# Altium project PCB_Batterie_ESP.PrjPcb
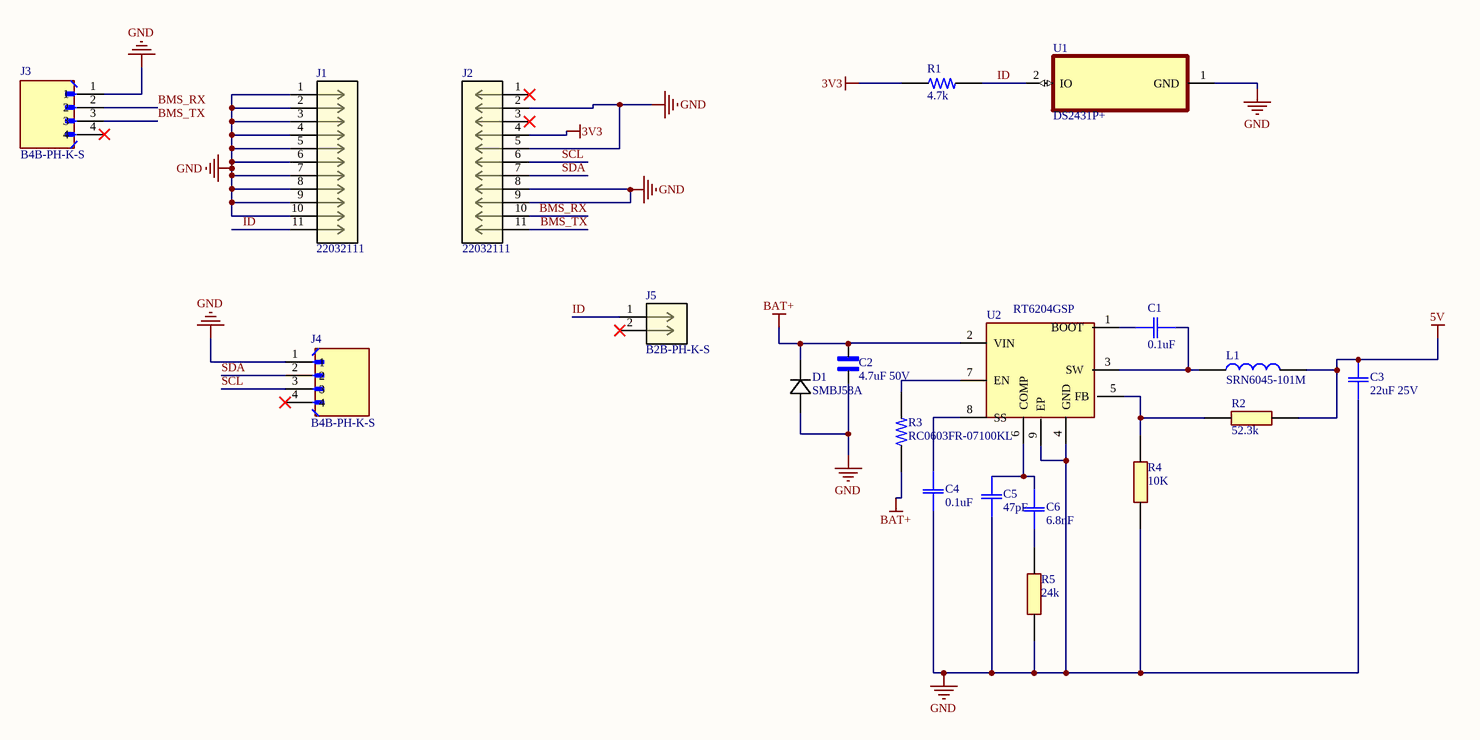
[diagram p0: PCB_Batterie_ESP.SchDoc]
1 sheet, 20 parts. Net scope: global (net labels, ports and power ports of the same name join across sheets).
Board file: PCB_Batterie_ESP.PcbDoc

## Sheet PCB_Batterie_ESP.SchDoc
size A2; SheetNumber: 1; SheetTotal: 1

### Parts
C1  0.1uF  [CAP_CL10_SAM]
C2  4.7uF 50V  [CAPC3216X180N]
C3  22uF 25V  [CAP_CC0805_YAG]
C4  0.1uF  [CAP_CL10_SAM]
C5  47pF  [CAP_CL10_SAM]
C6  6.8nF  [CAP_CL10_SAM]
D1  SMBJ58A  [SMB_STM]
J1  22032111  [CONN_SD-4030-0001_11_MOL]
J2  22032111  [CONN_SD-4030-0001_11_MOL]
J3  B4B-PH-K-S  [JST_B4B-PH-K-S]
J4  B4B-PH-K-S  [JST_B4B-PH-K-S]
J5  B2B-PH-K-S  [CONN2_B2B-PH-K-S_JST]
L1  SRN6045-101M  [SRN6045101M]
R1  4.7k  [RESC1607X60N]
R2  52.3k  [RESC1608X55N]
R3  RC0603FR-07100KL  [RESC1607X60N]
R4  10K  [RESC1608X55N]
R5  24k  [RESC1608X55N]
U1  DS2431P+  [21-0382_D6+1_MXM]
U2  RT6204GSP  [SOIC127P600X175-9N]

### Nets
3V3: J2.4 R1.1
5V: C3.2 L1.2 R2.2
BAT+: C2.2 D1.1 R3.1 U2.2(VIN)
GND: C2.1 C3.1 C4.1 C5.1 D1.2 J1.1 J1.2 J1.3 J1.4 J1.5 J1.6 J1.7 J1.8 J1.9 J1.10 J2.2 J2.5 J2.8 J2.9 J3.1 J4.1 R4.1 R5.1 U1.1(GND) U2.4(GND) U2.9(EP)
BMS_RX: J2.10 J3.2
BMS_TX: J2.11 J3.3
ID: J1.11 J5.1 R1.2 U1.2(IO)
SCL: J2.6 J4.3
SDA: J2.7 J4.2
NetC1_1: C1.1 L1.1 U2.3(SW)
NetC1_2: C1.2 U2.1(BOOT)
NetC4_2: C4.2 U2.8(SS)
NetC5_2: C5.2 C6.2 U2.6(COMP)
NetC6_1: C6.1 R5.2
NetR2_1: R2.1 R4.2 U2.5(FB)
NetR3_2: R3.2 U2.7(EN)

Not connected (* = marked no-connect by the designer): J2 1* 3*; J3 4*; J4 4*; J5 2*

### Library data of the parts
C1 C4 = CL10B104JB8NNNC: CAP CER 0.1UF 50V X7R 0603; Manufacturer_Name: Samsung; Copyright: Copyright (C) 2025 Ultra Librarian. All rights reserved.; Manufacturer_Part_Number: CL10B104JB8NNNC
C2 = CL31B475KBHNFNE: 4.7 ÂµF Â±10% 50V Ceramic Capacitor X7R 1206 (3216 Metric); MF: Samsung; SnapEDA_Link: https://www.snapeda.com/parts/CL31B475KBHNFNE/Samsung/view-part/?ref=snap; Package: SMD-2 Samsung; Value: *; MP: CL31B475KBHNFNE; Check_prices: https://www.snapeda.com/parts/CL31B475KBHNFNE/Samsung/view-part/?ref=eda
C3 = CC0805MKX5R8BB226: CAP CER 22UF 25V X5R 0805; Manufacturer_Name: Yageo; Copyright: Copyright (C) 2025 Ultra Librarian. All rights reserved.; Manufacturer_Part_Number: CC0805MKX5R8BB226
C5 = CL10C470JB8NNNC: CAP CER 47PF 50V C0G/NP0 0603; Manufacturer_Name: Samsung; Copyright: Copyright (C) 2025 Ultra Librarian. All rights reserved.; Manufacturer_Part_Number: CL10C470JB8NNNC
C6 = CL10B682JB8NNNC: CAP CER 6.8nF 50V X7R 0603; Manufacturer_Name: Samsung; Copyright: Copyright (C) 2026 Ultra Librarian. All rights reserved.; Manufacturer_Part_Number: CL10B682JB8NNNC
D1 = SMBJ58A: TVS DIODE 58VWM 93.6VC DO214AA; Manufacturer_Name: STMicroelectronics; Copyright: Copyright (C) 2025 Ultra Librarian. All rights reserved.; Manufacturer_Part_Number: SMBJ58A
J1 J2 = 22032111: KK 254 Wire-to-Board Header, Single Row, Vertical, 11 Circuits, PA Polyamide Nylon, Tin (Sn) Plating; Manufacturer_Name: Molex Connector Corporation; Type: Headers, Male Pins; Copyright: Copyright (C) 2025 Ultra Librarian. All rights reserved.; Manufacturer_Part_Number: 22032111; RefDes: RefDes
J3 J4 = B4B-PH-K-S: MF: {'manufacturer': u'JST Sales America Inc.'}; Package: None; Price: None; Value: *; MP: B4B-PH-K-S; Availability: Unavailable
J5 = B2B-PH-K-S: Description; Manufacturer_Name: JST; Copyright: Copyright (C) 2026 Ultra Librarian. All rights reserved.; Manufacturer_Part_Number: B2B-PH-K-S; RefDes: RefDes; Type: Type
L1 = SRN6045-101M: Bourns SRN6045 Series Shielded Wire-wound SMD Inductor with a Ferrite Core, 100 uH +/-20% 0.8A Idc; Geometry.Height: 4.5mm; Mouser Part Number: 652-SRN6045-101M; Mouser Price/Stock: https://www.mouser.co.uk/ProductDetail/Bourns/SRN6045-101M?qs=opBjA1TV9030ahoS0FyAMQ%3D%3D; Manufacturer_Name: Bourns; Manufacturer_Part_Number: SRN6045-101M; Datasheet Link: http://www.bourns.com/docs/Product-Datasheets/SRN6045.pdf
R1 = RC0603FR-074K7L: Surface Mount Thick Film Resistor, RC Series, 4.7 kohm, 100 mW, - 1%, 50 V, 0603 [1608 Metric] RoHS Compliant: Yes; MF: Yageo Corporation; MP: RC0603FR074K7L; SnapEDA_Link: https://www.snapeda.com/parts/RC0603FR074K7L/Yageo/view-part/?ref=snap; Package: 0603-2 YAGEO; Value: *; Check_prices: https://www.snapeda.com/parts/RC0603FR074K7L/Yageo/view-part/?ref=eda
R2 = RC0603FR-0752K3L: YAGEO (PHYCOMP) RC0603 F; Manufacturer_Name: Yageo Group; Geometry.Height: 0.55mm; Mouser Part Number: 603-RC0603FR-0752K3L; Mouser Price/Stock: https://www.mouser.co.uk/ProductDetail/YAGEO/RC0603FR-0752K3L?qs=gt6vzsuosg1%252BFdjgr%2FxeWg%3D%3D; Manufacturer_Part_Number: RC0603FR-0752K3L; Datasheet Link: http://www.yageo.com/documents/recent/PYu-RC0603_51_RoHS_L_v5.pdf
R3 = RC0603FR-07100KL: 100 kOhms Â±1% 0.1W, 1/10W Chip Resistor 0603 (1608 Metric) Moisture Resistant Thick Film; MF: Yageo; SnapEDA_Link: https://www.snapeda.com/parts/RC0603FR-07100KL/Yageo/view-part/?ref=snap; Package: 0603 Yageo; Value: *; MP: RC0603FR-07100KL; Check_prices: https://www.snapeda.com/parts/RC0603FR-07100KL/Yageo/view-part/?ref=eda
R4 = RC0603FR-0710KL: Yageo RC Series Thick Film Surface Mount Resistor 0603 Case 10k; Manufacturer_Name: Yageo Group; Geometry.Height: 0.55mm; Mouser Part Number: 603-RC0603FR-0710KL; Mouser Price/Stock: https://www.mouser.co.uk/ProductDetail/YAGEO/RC0603FR-0710KL?qs=grNVn54RoB%252B3GtjbJj3wJQ%3D%3D; Manufacturer_Part_Number: RC0603FR-0710KL; Datasheet Link: http://www.yageo.com/documents/recent/PYu-RC0603_51_RoHS_L_v5.pdf
R5 = RC0603FR-0724KL: Yageo 24k, 0603 (1608M) Thick Film SMD Resistor +/-1% 0.1 W, 0.2 W - RC0603FR-0724KL; Manufacturer_Name: Yageo Group; Geometry.Height: 0.55mm; Mouser Part Number: 603-RC0603FR-0724KL; Mouser Price/Stock: https://www.mouser.co.uk/ProductDetail/YAGEO/RC0603FR-0724KL?qs=NUn4zLqw%2FjL4A5exBX9GHg%3D%3D; Manufacturer_Part_Number: RC0603FR-0724KL; Datasheet Link: https://www.yageo.com/upload/media/product/productsearch/datasheet/rchip/PYu-RC_Group_51_RoHS_L_12.pdf
U1 = DS2431P+: EEPROM Memory IC 1Kb (256 x 4) 1-WireÂ® 2Âµs 6-TSOC; MF: Maxim Integrated; Availability: Warning; SnapEDA_Link: https://www.snapeda.com/parts/DS2431P+/Maxim%20Integrated/view-part/479429/?ref=snap; Value: *; MP: DS2431P+; Package: TSOC-6 Maxim; Purchase-URL: https://pricing.snapeda.com/search/part/DS2431P+/?ref=eda; Price: None
U2 = RT6204GSP: Switching Voltage Regulators 500mA, 60V, 350kHz Synchronous Step-Down Converter; Manufacturer_Name: RICHTEK; Geometry.Height: 1.753mm; Mouser Part Number: *; Mouser Price/Stock: *; Manufacturer_Part_Number: RT6204GSP; Datasheet Link: https://4donline.ihs.com/images/VipMasterIC/IC/RHTK/RHTK-S-A0013504612/RHTK-S-A0013505728-1.pdf?hkey=61A2E4C270F0397D049F8F05BD4F1054